# Altium schematic sheet Power_Section.SchDoc
size A4; DocumentNumber: 2; SheetNumber: 2; SheetTotal: 7
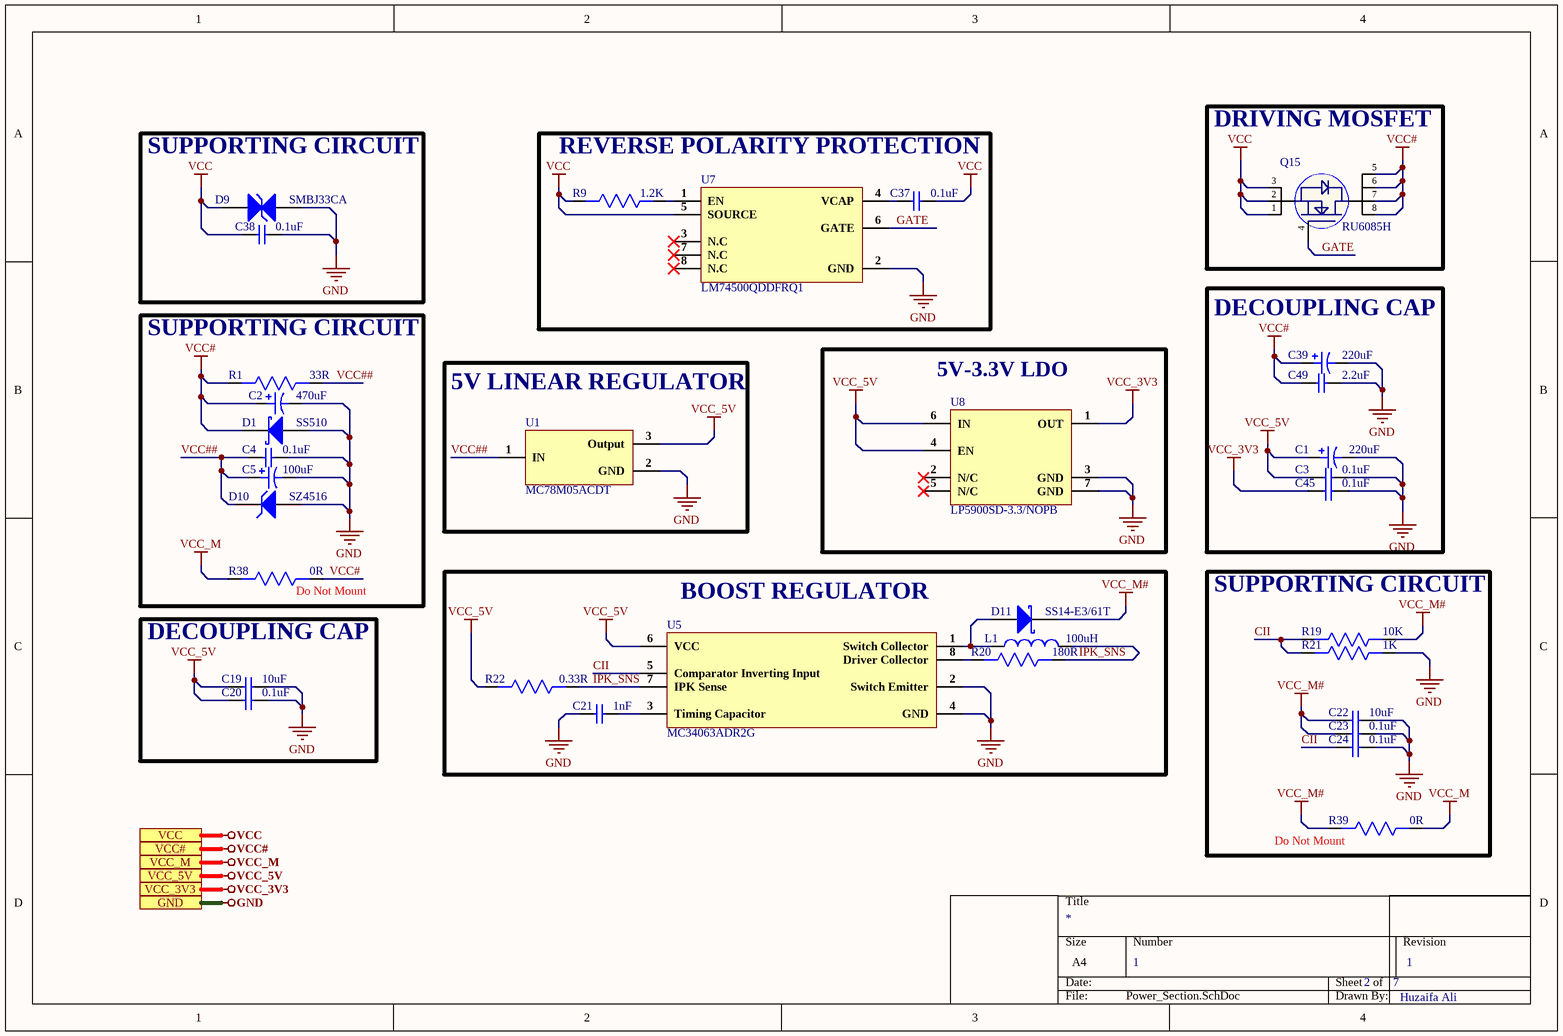
[diagram p0: Power_Section.SchDoc]

## Parts
C1  220uF  [UCD1H221MNL1GS]
C2  470uF  [VT1H471MI135000CE0]
C3  0.1uF  [Cap0603]
C4  0.1uF  [Cap0603]
C5  100uF  [CAP- 2917]
C19  10uF  [Cap0603]
C20  0.1uF  [Cap0603]
C21  1nF  [Cap0603]
C22  10uF  [Cap0603]
C23  0.1uF  [Cap0603]
C24  0.1uF  [Cap0603]
C37  0.1uF  [Cap0603]
C38  0.1uF  [Cap0603]
C39  220uF  [UCD1H221MNL1GS]
C45  0.1uF  [Cap0603]
C49  2.2uF  [Cap-0603]
D1  SS510  [SMB]
D9  SMBJ33CA  [SMBJ33CA]
D10  SZ4516  [SMA]
D11  SS14-E3/61T  [SMA]
L1  100uH  [SRN8040-101M]
Q15  RU6085H  [RU6085H]
R1  33R  [Res0603]
R9  1.2K  [Res-0603]
R19  10K  [Res0603]
R20  180R  [Res0603]
R21  1K  [Res0603]
R22  0.33R  [Res0603]
R38  0R  [Res0603]
R39  0R  [Res0603]
U1  MC78M05ACDT  [DPAK]
U5  MC34063ADR2G  [SOIC-8]
U7  LM74500QDDFRQ1  [TSOT-23-8]
U8  LP5900SD-3.3/NOPB  [WSON-6]

## Blocks framed on the sheet
SUPPORTING CIRCUIT: C38 D9
REVERSE POLARITY PROTECTION: C37 R9 U7
DRIVING MOSFET: Q15
DECOUPLING CAP: C1 C3 C39 C45 C49
SUPPORTING CIRCUIT: C2 C4 C5 D1 D10 R1 R38
5V-3.3V LDO: U8
5V LINEAR REGULATOR: U1
DECOUPLING CAP: C19 C20
BOOST REGULATOR: C21 D11 L1 R20 R22 U5
SUPPORTING CIRCUIT: C22-C24 R19 R21 R39

## Ports
GND, VCC, VCC#, VCC_3V3, VCC_5V, VCC_M

## Nets
GND: C1.2 C2.2 C3.2 C4.2 C5.2 C19.2 C20.2 C21.1 C22.2 C23.2 C24.2 C38.2 C39.2 C45.2 C49.2 D1.2(A) D9.2(A2) D10.2(A) R21.1 U1.2(GND) U5.2(Switch_Emitter) U5.4(GND) U7.2(GND) U8.3(GND) U8.7(GND) ; port GND
VCC: C37.2 C38.1 D9.1(A1) Q15.1(S) Q15.2(S) Q15.3(S) R9.2 U7.5(SOURCE) ; port VCC
VCC#: C2.1 C39.1 C49.1 D1.1(K) Q15.5(D) Q15.6(D) Q15.7(D) Q15.8(D) R1.2 R38.1 ; port VCC#
VCC_3V3: C45.1 U8.1(OUT) ; port VCC_3V3
VCC_5V: C1.1 C3.1 C19.1 C20.1 R22.2 U1.3(Output) U5.6(VCC) U8.4(EN) U8.6(IN) ; port VCC_5V
VCC_M: R38.2 R39.1 ; port VCC_M
VCC_M#: C22.1 C23.1 D11.1(K) R19.1 R39.2
CII: C24.1 R19.2 R21.2 U5.5(Comparator_Inverting_Input)
GATE: Q15.4(G) U7.6(GATE)
IPK_SNS: L1.2 R20.1 R22.1 U5.7(IPK_Sense)
VCC##: C4.1 C5.1 D10.1(K) R1.1 U1.1(IN)
NetC21_2: C21.2 U5.3(Timing_Capacitor)
NetC37_1: C37.1 U7.4(VCAP)
NetD11_2: D11.2(A) L1.1 U5.1(Switch_Collector)
NetR9_1: R9.1 U7.1(EN)
NetR20_2: R20.2 U5.8(Driver_Collector)

Not connected (* = marked no-connect by the designer): U7 3(N.C)* 7(N.C)* 8(N.C)*; U8 2(N/C)* 5(N/C)*

## Notes on the sheet
- (near R38) Do Not Mount
- (near R39) Do Not Mount
- 1
- Huzaifa Ali

## Library data of the parts
C1 C39 = UCD1H221MNL1GS: CAP ALUM 220UF 20% 50V SMD; Manufacturer: Nichicon; Ripple Current: 700mA; Impedance: 160mR; Leakage Current: 3uA; Life (Hours): 5000Hour; Dissipation Factor: 0.1%; Supplier 1: Digi-Key; Manufacturer Part Number: UCD1H221MNL1GS; RoHS: Yes; Category: Aluminum Electrolytic Capacitors; Pricing 1: 1=0.85000, 10=0.60200, 50=0.45480, 100=0.39620 (USD); Mount: Surface Mount,PCB; Case/Package: Radial; Min Operating Temperature: -55°C; Max Operating Temperature: 105°C; Capacitance: 220uF; Tolerance: 20%; Voltage Rating: 50V; Packaging: Tape and Reel; Package Quantity: 1; Voltage Rating (DC): 50V; Termination: SMD/SMT; Voltage: 50V; Features: General Purpose; Series: CD; Construction: Cylindrical; Diameter: 10mm; Length: 10mm; Height: 10mm; Height - Seated (Max): 0.394inch; Radiation Hardening: No; Lead Free: Lead Free; RoHS Compliant: Yes; ComponentLink1URL: https://datasheet.ciiva.com/11776/0900766b80ebdadd-11776792.pdf?src-supplier=RSComponents; ComponentLink1Description: https://datasheet.ciiva.com/11776/0900766b80ebdadd-11776792.pdf?src-supplier=RSComponents; ComponentLink2URL: https://datasheet.ciiva.com/5362/e-cd-22158-5362489.pdf?src-supplier=Mouser; ComponentLink2Description: https://datasheet.ciiva.com/5362/e-cd-22158-5362489.pdf?src-supplier=Mouser; ComponentLink3URL: https://datasheet.ciiva.com/11684/e-cd-11684678.pdf?src-supplier=Avnet; ComponentLink3Description: https://datasheet.ciiva.com/11684/e-cd-11684678.pdf?src-supplier=Avnet; ComponentLink4URL: https://datasheet.ciiva.com/15037/e-cd-15037119.pdf?src-supplier=Digi-Key; ComponentLink4Description: https://datasheet.ciiva.com/15037/e-cd-15037119.pdf?src-supplier=Digi-Key; ComponentLink5URL: https://datasheet.ciiva.com/16393/e-cd-16393493.pdf?src-supplier=Future+Electronics; ComponentLink5Description: https://datasheet.ciiva.com/16393/e-cd-16393493.pdf?src-supplier=Future+Electronics; ComponentLink6URL: https://datasheet.ciiva.com/17354/e-cd-17354606.pdf?src-supplier=Avnet+Europe; ComponentLink6Description: https://datasheet.ciiva.com/17354/e-cd-17354606.pdf?src-supplier=Avnet+Europe; Supplier Part Number 1: 493-6390-1-ND
C2 = VT1H471MI135000CE0: 470uF ±20% 50V 12.5mm 13.5mm 1000hrs 105℃ -40℃~+105℃ SMD,12.5x13.5mm Aluminum Electrolytic Capacitors - SMD RoHS; Manufacturer: Changzhou Huawei Elec; Package: SMD,12.5x13.5mm; Capacitance: 470uF; Tolerance: ±20%; Rated Voltage: 50V; φD: 12.5mm; L: 13.5mm; Lifetime @ Temp: 1000hrs 105℃; Operating Temperature: -40℃~+105℃
C3 C4 C20 C23 C24 C37 C38 C45 = CC0603KRX7R0BB104: CAP CER 0.1UF 100V X7R 0603; Manufacturer: Yageo; Capacitance: 100nF; Tolerance: 10%; Supplier 1: Digi-Key; Manufacturer Part Number: CC0603KRX7R0BB104; RoHS: Yes; Category: Ceramic Capacitors; Stock 1: 60476; Pricing 1: 1=0.19000, 10=0.13500, 50=0.07680, 100=0.06370, 500=0.04466, 1000=0.03696 (USD); Mount: Surface Mount; Case/Package: 0603; Case Code (Metric): 1608; Case Code (Imperial): 0603; Weight: 7.1E-05oz; Min Operating Temperature: -55°C; Max Operating Temperature: 125°C; Package Quantity: 4000; Voltage Rating: 100V; Packaging: Tape and Reel; Dielectric: X7R; Termination: SMD/SMT; Resistor Type: Ceramic; Voltage Rating (DC): 100V; Series: CC; Length: 0.063inch; Width: 0.031inch; Thickness: 0.035inch; Depth: 0.8mm; Lead Free: Lead Free; RoHS Compliant: Yes; ComponentLink1URL: https://datasheet.ciiva.com/6277/mlccorderingcode-6277030.pdf?src-supplier=Digi-Key; ComponentLink1Description: https://datasheet.ciiva.com/6277/mlccorderingcode-6277030.pdf?src-supplier=Digi-Key; ComponentLink2URL: https://datasheet.ciiva.com/6277/mlccorderingcode-6277081.pdf?src-supplier=Digi-Key; ComponentLink2Description: https://datasheet.ciiva.com/6277/mlccorderingcode-6277081.pdf?src-supplier=Digi-Key; ComponentLink3URL: https://datasheet.ciiva.com/6277/mlccorderingcode-6277082.pdf?src-supplier=Digi-Key; ComponentLink3Description: https://datasheet.ciiva.com/6277/mlccorderingcode-6277082.pdf?src-supplier=Digi-Key; Supplier Part Number 1: 311-1523-1-ND
C5 = TAJE107M025RNJ: CAP TANT 100UF 20% 25V 2917; Manufacturer: Kyocera AVX; ESR (Equivalent Series Resistance): 300mR; Leakage Current: 25uA; Polarity: Polar; Dissipation Factor: 10%; Supplier 1: Mouser; Manufacturer Part Number: TAJE107M025RNJ; RoHS: Yes; Category: Tantalum Capacitors; Stock 1: 109; Pricing 1: 1=2.81000, 10=2.81000, 50=2.81000, 100=2.19000, 1000=1.76000, 10000=1.76000 (USD); Mount: Surface Mount; Case/Package: 2917; Number of Pins: 2; Case Code (Imperial): 2917; Case Code (Metric): 7343; Min Operating Temperature: -55°C; Max Operating Temperature: 125°C; Capacitance: 100uF; Tolerance: 20%; Packaging: Tape and Reel; Voltage Rating: 25V; Voltage Rating (DC): 25V; Features: General Purpose; Package Quantity: 1; Termination: SMD/SMT; Series: TAJ; Construction: Flat; Length: 7.3mm; Width: 4.3mm; Height: 4.3mm; Depth: 4.3mm; Height - Seated (Max): 0.169inch; Radiation Hardening: No; Lead Free: Lead Free; RoHS Compliant: Yes; REACH SVHC: No SVHC; ComponentLink1URL: https://datasheet.ciiva.com/26787/taje107m025rnj-26787048.pdf?src-supplier=IIIC; ComponentLink1Description: https://datasheet.ciiva.com/26787/taje107m025rnj-26787048.pdf?src-supplier=IIIC; ComponentLink2URL: https://datasheet.ciiva.com/265/taj-265541.pdf?src-supplier=Digi-Key; ComponentLink2Description: https://datasheet.ciiva.com/265/taj-265541.pdf?src-supplier=Digi-Key; ComponentLink3URL: https://datasheet.ciiva.com/265/taj-265542.pdf?src-supplier=Digi-Key; ComponentLink3Description: https://datasheet.ciiva.com/265/taj-265542.pdf?src-supplier=Digi-Key; ComponentLink4URL: https://datasheet.ciiva.com/265/taj-265540.pdf?src-supplier=Digi-Key; ComponentLink4Description: https://datasheet.ciiva.com/265/taj-265540.pdf?src-supplier=Digi-Key; ComponentLink5URL: https://datasheet.ciiva.com/28609/1719052-28609254.pdf?src-supplier=Element14; ComponentLink5Description: https://datasheet.ciiva.com/28609/1719052-28609254.pdf?src-supplier=Element14; ComponentLink6URL: https://datasheet.ciiva.com/11230/taj-11230456.pdf?src-supplier=Avnet; ComponentLink6Description: https://datasheet.ciiva.com/11230/taj-11230456.pdf?src-supplier=Avnet; ComponentLink7URL: https://datasheet.ciiva.com/17339/taj-17339677.pdf?src-supplier=Avnet+Europe; ComponentLink7Description: https://datasheet.ciiva.com/17339/taj-17339677.pdf?src-supplier=Avnet+Europe; ComponentLink8URL: https://datasheet.ciiva.com/22667/1719052-22667581.pdf?src-supplier=Element14; ComponentLink8Description: https://datasheet.ciiva.com/22667/1719052-22667581.pdf?src-supplier=Element14; Supplier Part Number 1: 581-TAJE107M025RNJ
C19 C22 = CL10A106MA8NRNC: CAP CER 10UF 25V X5R 0603; Manufacturer: Samsung; Tolerance: 20%; Supplier 1: Avnet; Manufacturer Part Number: CL10A106MA8NRNC; RoHS: Yes; Category: Ceramic Capacitors; Pricing 1: 4000=0.03753, 8000=0.03700, 16000=0.03595, 24000=0.03515, 32000=0.03383, 40000=0.03304, 400000=0.03225 (USD); Mount: Surface Mount; Case/Package: 0603; Case Code (Metric): 1608; Case Code (Imperial): 0603; Contact Plating: Tin; Min Operating Temperature: -55°C; Max Operating Temperature: 85°C; Package Quantity: 1; Packaging: Tape and Reel; Capacitance: 10uF; Voltage Rating: 25V; Dielectric: X5R; Termination: Wraparound; Series: CL; Construction: Flat; Length: 0.063inch; Width: 0.031inch; Thickness: 0.035inch; Lead Free: Lead Free; RoHS Compliant: Yes; ComponentLink1URL: https://datasheet.ciiva.com/25766/cl10a106ma8nrnc-25766562.pdf?src-supplier=Digi-Key; ComponentLink1Description: https://datasheet.ciiva.com/25766/cl10a106ma8nrnc-25766562.pdf?src-supplier=Digi-Key; Supplier Part Number 1: CL10A106MA8NRNC
C21 = CL10B102KC8NNNC: CAP CER 1nF 100V X7R 0603; Manufacturer: Samsung; Material: Ceramic; Tolerance: 10%; Supplier 1: Avnet; Manufacturer Part Number: CL10B102KC8NNNC; RoHS: Yes; Category: Ceramic Capacitors; Stock 1: 184000; Pricing 1: 4000=0.00988, 8000=0.00987, 16000=0.00986, 24000=0.00985, 32000=0.00984, 40000=0.00982, 400000=0.00981 (USD); Mount: Surface Mount; Case/Package: 0603; Case Code (Metric): 1608; Case Code (Imperial): 0603; Contact Plating: Tin; Min Operating Temperature: -55°C; Max Operating Temperature: 125°C; Capacitance: 1nF; Dielectric: X7R; Packaging: Tape and Reel; Package Quantity: 1; Voltage Rating: 100V; Voltage: 100V; Voltage Rating (DC): 100V; Series: CL; Construction: Flat; Length: 1.6mm; Width: 0.031inch; Height: 0.8mm; Thickness: 0.035inch; Depth: 0.8mm; Radiation Hardening: No; Lead Free: Lead Free; RoHS Compliant: Yes; ComponentLink1URL: https://datasheet.ciiva.com/25799/cl10b102kc8nnnc-25799476.pdf?src-supplier=Digi-Key; ComponentLink1Description: https://datasheet.ciiva.com/25799/cl10b102kc8nnnc-25799476.pdf?src-supplier=Digi-Key; ComponentLink2URL: https://datasheet.ciiva.com/29198/458286-da-01-en-vs-kondensator-0603-29198496.pdf?src-supplier=Conrad; ComponentLink2Description: https://datasheet.ciiva.com/29198/458286-da-01-en-vs-kondensator-0603-29198496.pdf?src-supplier=Conrad; ComponentLink3URL: https://datasheet.ciiva.com/26838/getdatasheetpartid-640779-26838395.pdf?src-supplier=Verical; ComponentLink3Description: https://datasheet.ciiva.com/26838/getdatasheetpartid-640779-26838395.pdf?src-supplier=Verical; ComponentLink4URL: https://datasheet.ciiva.com/26310/mlcc-catalogdownload2013-eng-26310266.pdf?src-supplier=Distrelec; ComponentLink4Description: https://datasheet.ciiva.com/26310/mlcc-catalogdownload2013-eng-26310266.pdf?src-supplier=Distrelec; ComponentLink5URL: https://datasheet.ciiva.com/16199/cl05b104kq5nnnc-16199246.pdf?src-supplier=Future+Electronics; ComponentLink5Description: https://datasheet.ciiva.com/16199/cl05b104kq5nnnc-16199246.pdf?src-supplier=Future+Electronics; Supplier Part Number 1: CL10B102KC8NNNC
C49 = GRM188R6YA225KA12D: CAP, 2.2µF, 35V, 10%, X5R, 0603; Manufacturer: Murata; Material: Ceramic; Supplier 1: Digi-Key; Manufacturer Part Number: GRM188R6YA225KA12D; RoHS: Yes; Category: Ceramic Capacitors; Stock 1: 81665; Pricing 1: 1=0.21000, 10=0.14100, 50=0.08480, 100=0.07170, 500=0.04904, 1000=0.04338 (USD); Mount: Surface Mount; Case/Package: 0603; Case Code (Metric): 1608; Case Code (Imperial): 0603; Weight: 0.000222oz; Min Operating Temperature: -55°C; Max Operating Temperature: 85°C; Package Quantity: 4000; Packaging: Tape and Reel; Capacitance: 2.2uF; Tolerance: 10%; Voltage Rating: 35V; Dielectric: X5R; Voltage: 35V; Termination: SMD/SMT; Voltage Rating (DC): 35V; Series: GRM; Length: 1.6mm; Width: 0.8mm; Height: 0.8mm; Thickness: 0.035inch; Depth: 0.8mm; REACH SVHC: No SVHC; Lead Free: Lead Free; RoHS Compliant: Yes; ComponentLink1URL: https://datasheet.ciiva.com/14906/partnumbering-e-01-14906490.pdf?src-supplier=Digi-Key; ComponentLink1Description: https://datasheet.ciiva.com/14906/partnumbering-e-01-14906490.pdf?src-supplier=Digi-Key; ComponentLink2URL: https://datasheet.ciiva.com/14906/partnumbering-e-01-14906491.pdf?src-supplier=Digi-Key; ComponentLink2Description: https://datasheet.ciiva.com/14906/partnumbering-e-01-14906491.pdf?src-supplier=Digi-Key; ComponentLink3URL: https://datasheet.ciiva.com/14906/partnumbering-e-01-14906492.pdf?src-supplier=Digi-Key; ComponentLink3Description: https://datasheet.ciiva.com/14906/partnumbering-e-01-14906492.pdf?src-supplier=Digi-Key; Supplier Part Number 1: 490-7204-1-ND; LCSC Part Number: C86017
D1 = SS510: 300μA@100V 100V Single 5A 850mV@5A SMB Schottky Barrier Diodes (SBD) ROHS; Manufacturer: YFW; Manufacturer Part Number: SS510; ComponentLink1Description: LCSC; ComponentLink1URL: https://lcsc.com/product-detail/Schottky-Barrier-Diodes-SBD_YFW-SS510_C2898359.html
D9 = SMBJ33CA: 11.3A 53.3V 36.7V 33V Bi-Directional SMB(DO-214AA) TVS ROHS; Manufacturer: Brightking Elec (TAIWAN); Package: DO-124AA; Maximum Clamping Voltage: 53.3V; Breakdown Voltage (Min): 36.7V; Reverse Stand-Off Voltage (Vrwm): 33V; Polarity: Bi-directional
D10 = SZ4516: 500nA@12.2V ±5% 8Ω Single 2W 16V SMA Zener Diodes ROHS; Manufacturer: LGE; Manufacturer Part Number: SZ4516; ComponentLink1Description: LCSC; ComponentLink1URL: https://lcsc.com/product-detail/span-style-background-color-ff0-Zener-span-Diodes_LGE-SZ4516_C2903793.html
D11 = SS14-E3/61T: 40V 500mV@1A 1A SMA(DO-214AC) Schottky Barrier Diodes (SBD) ROHS; Manufacturer: Vishay Semiconductors; Forward Voltage: 500mV; Max Reverse Current: 200uA; Element Configuration: Single; Peak Non-Repetitive Surge Current: 40A; Polarity: Standard; Supplier 1: Arrow Electronics; Manufacturer Part Number: SS14-E3/61T; RoHS: Yes; Category: Rectifier Diodes; Stock 1: 100; Pricing 1: 1=0.14040, 10=0.13900, 25=0.11710, 100=0.10990 (USD); Mount: Surface Mount; Case/Package: SMA; Number of Pins: 2; Contact Plating: Tin,Matte; Min Operating Temperature: -65°C; Max Operating Temperature: 125°C; Packaging: Tape and Reel; Forward Current: 1A; Max Repetitive Reverse Voltage (Vrrm): 40V; Max Forward Surge Current (Ifsm): 40A; Voltage Rating (DC): 40V; Current Rating: 1A; Output Current: 1A; Max Surge Current: 40A; Package Quantity: 1; Max Reverse Leakage Current: 200uA; Average Rectified Current: 1A; Current: 1A; Voltage: 40V; Max Reverse Voltage (DC): 40V; Series: -; Termination: SMD/SMT; Length: 4.6mm; Width: 2.9mm; Radiation Hardening: No; Lead Free: Lead Free; REACH SVHC: Unknown; Supplier Part Number 1: SS14-E3/61T
L1 = SRN8040-101M: FIXED IND 100UH 1A 400 MOHM SMD; Manufacturer: Bourns; Core Material: Ferrite; Material: Steel; Inductance Tolerance: 20%; Shielding: Shielded; DC Resistance (DCR): 400mR; Self Resonant Frequency: 6MHz; Test Frequency: 100kHz; Supplier 1: Arrow Electronics; Manufacturer Part Number: SRN8040-101M; RoHS: Yes; Category: Fixed Inductors; Stock 1: 70; Pricing 1: 1=0.74330, 10=0.57270, 25=0.52540 (USD); Mount: Surface Mount; Case/Package: Nonstandard; Number of Pins: 2; Weight: 0.028607oz; Min Operating Temperature: -40°C; Max Operating Temperature: 125°C; Package Quantity: 1000; Packaging: Tape and Reel; Tolerance: 20%; Inductance: 100uH; Current Rating: 1A; Saturation Current: 1A; Max DC Current: 1A; Termination: SMD/SMT; Resistor Type: Wirewound; RMS Current (Irms): 1A; DC Current: 1A; Series: SRN8040; Sample Rate (Hz): 100kHz; Length: 8mm; Width: 8mm; Height: 4mm; Height - Seated (Max): 0.157inch; Depth: 8.3mm; REACH SVHC: No SVHC; Military Standard: Not; RoHS Compliant: Yes; ComponentLink1URL: https://datasheet.ciiva.com/11802/0900766b80fe1f3f-11802577.pdf?src-supplier=RSComponents; ComponentLink1Description: https://datasheet.ciiva.com/11802/0900766b80fe1f3f-11802577.pdf?src-supplier=RSComponents; ComponentLink2URL: https://datasheet.ciiva.com/1049/srn8040-1049477.pdf?src-supplier=Digi-Key; ComponentLink2Description: https://datasheet.ciiva.com/1049/srn8040-1049477.pdf?src-supplier=Digi-Key; ComponentLink3URL: https://datasheet.ciiva.com/1049/srn8040-1049478.pdf?src-supplier=Digi-Key; ComponentLink3Description: https://datasheet.ciiva.com/1049/srn8040-1049478.pdf?src-supplier=Digi-Key; ComponentLink4URL: https://datasheet.ciiva.com/7849/1695391-7849526.pdf?src-supplier=Element14; ComponentLink4Description: https://datasheet.ciiva.com/7849/1695391-7849526.pdf?src-supplier=Element14; ComponentLink5URL: https://datasheet.ciiva.com/28561/1733536-28561112.pdf?src-supplier=Element14; ComponentLink5Description: https://datasheet.ciiva.com/28561/1733536-28561112.pdf?src-supplier=Element14; ComponentLink6URL: https://datasheet.ciiva.com/6689/srn8040-6689481.pdf?src-supplier=Digi-Key; ComponentLink6Description: https://datasheet.ciiva.com/6689/srn8040-6689481.pdf?src-supplier=Digi-Key; ComponentLink7URL: https://datasheet.ciiva.com/8515/srn8040-8515246.pdf?src-supplier=Avnet; ComponentLink7Description: https://datasheet.ciiva.com/8515/srn8040-8515246.pdf?src-supplier=Avnet; Supplier Part Number 1: SRN8040-101M
Q15 = RU6085H: 60V 80A 2.5W 7mΩ@10V,20A 3V@250μA N Channel SOP-8_150mil MOSFETs ROHS; Manufacturer: Shenzhen; Manufacturer Part No: RU6085H; Package: SOP-8_150mil; ComponentLink1Description: LCSC; ComponentLink1URL: https://lcsc.com/product-detail/MOSFETs_Shenzhen-ruichips-Semicon-RU6085H_C181990.html
R1 = RC0603FR-0733RL: RES SMD 33 OHM 1% 1/10W 0603; Manufacturer: Yageo; Temperature Coefficient: 100ppm/°C; Voltage Rating (DC): 50V; Power Rating: 100mW; Voltage Rating: 75V; Supplier 1: Digi-Key; Manufacturer Part Number: RC0603FR-0733RL; Stock 1: 5529439; Pricing 1: 1=0.1, 10=0.023, 100=0.0094, 1000=0.00421, 2500=0.00366 (USD); Case/Package: 0603; Number of Pins: 2; Weight: 7.1E-05oz; Case Code (Metric): 1608; Case Code (Imperial): 0603; Min Operating Temperature: -55°C; Max Operating Temperature: 155°C; Resistance: 33R; Tolerance: 1%; Composition: Thick Film; Packaging: Tape and Reel; Package Quantity: 1; Number of Terminations: 2; Termination: SMD/SMT; Military Standard: Not; Max Power Dissipation: 100mW; Features: Moisture Resistant; Length: 1.6mm; Height: 0.45mm; Width: 0.8mm; Depth: 0.8mm; Lead Pitch: 0.3mm; REACH SVHC: No SVHC; Lead Free: Lead Free; ComponentLink1URL: http://www.yageo.com/documents/recent/PYu-RC_Group_51_RoHS_L_10.pdf?src-supplier=Digi-Key; ComponentLink1Description: http://www.yageo.com/documents/recent/PYu-RC_Group_51_RoHS_L_10.pdf?src-supplier=Digi-Key; ComponentLink2URL: http://documents.rs-components.com/techlib://itc_doclist_GB.htm?stockno=5046562&src-supplier=RSComponents; ComponentLink2Description: http://documents.rs-components.com/techlib://itc_doclist_GB.htm?stockno=5046562&src-supplier=RSComponents; ComponentLink3URL: http://www.farnell.com/datasheets/38590.pdf?src-supplier=Element14; ComponentLink3Description: http://www.farnell.com/datasheets/38590.pdf?src-supplier=Element14; ComponentLink4URL: https://www.verical.com/server-webapp/html/getDatasheet?partID=326673&src-supplier=Verical; ComponentLink4Description: https://www.verical.com/server-webapp/html/getDatasheet?partID=326673&src-supplier=Verical; ComponentLink5URL: http://www.farnell.com/datasheets/1868787.pdf?src-supplier=Element14; ComponentLink5Description: http://www.farnell.com/datasheets/1868787.pdf?src-supplier=Element14; ComponentLink6URL: http://www.farnell.com/datasheets/2167052.pdf?src-supplier=Element14; ComponentLink6Description: http://www.farnell.com/datasheets/2167052.pdf?src-supplier=Element14; ComponentLink7URL: http://www.farnell.com/datasheets/443971.pdf?src-supplier=Element14; ComponentLink7Description: http://www.farnell.com/datasheets/443971.pdf?src-supplier=Element14; Supplier Part Number 1: 311-33.0HRCT-ND
R9 = RC0603FR-071K2L: RES SMD 1.2K OHM 1% 1/10W 0603; Manufacturer: Yageo; Power Rating: 100mW; Voltage Rating (DC): 50V; Resistance: 1.2kR; Temperature Coefficient: 100ppm/°C; Supplier 1: Digi-Key; Manufacturer Part Number: RC0603FR-071K2L; RoHS: Yes; Category: Chip SMD Resistors; Stock 1: 531140; Pricing 1: 1=0.10000, 10=0.02400, 100=0.00970, 1000=0.00436, 2500=0.00378 (USD); Case/Package: 0603; Number of Pins: 2; Case Code (Imperial): 0603; Case Code (Metric): 1608; Size Code: 0603; Min Operating Temperature: -55°C; Max Operating Temperature: 155°C; Tolerance: 1%; Packaging: Tape and Reel; Voltage Rating: 50V; Termination: SMD/SMT; Resistor Type: Thick Film; Features: Moisture Resistant; Series: RC; Max Power Dissipation: 100mW; Number of Terminations: 2; Construction: Rectangular; Resistance Tolerance: 1%; Length: 1.6mm; Width: 0.8mm; Height: 0.45mm; Depth: 0.8mm; REACH SVHC: No SVHC; Lead Free: Lead Free; Military Standard: Not; RoHS Compliant: Yes; Supplier Part Number 1: 311-1.20KHRCT-ND; LCSC Part Number: C114605
R19 = AC0603JR-0710KL: RES SMD 10K OHM 5% 1/10W 0603; Manufacturer: Yageo; Voltage Rating: 50V; Resistance: 10kR; Power Rating: 100mW; Temperature Coefficient: 100ppm/°C; Supplier 1: Future Electronics; Manufacturer Part Number: AC0603JR-0710KL; RoHS: Yes; Category: Chip SMD Resistors; Stock 1: 1533000; Pricing 1: 5000=0.00540 (USD); Case/Package: 0603; Case Code (Imperial): 0603; Case Code (Metric): 1608; Size Code: 0603; Min Operating Temperature: -55°C; Max Operating Temperature: 155°C; Packaging: Tape and Reel; Tolerance: 5%; Package Quantity: 1; Resistor Type: Thick Film; Termination: SMD/SMT; Number of Terminations: 2; Max Power Dissipation: 100mW; Features: Moisture Resistant,Automotive AEC-Q200,Anti-Sulfur; Series: AC; Construction: Rectangular; Length: 0.063inch; Width: 0.031inch; Height: 0.022inch; Depth: 0.8mm; Military Standard: Not; Lead Free: Lead Free; RoHS Compliant: Yes; ComponentLink1URL: https://datasheet.ciiva.com/5562/pyu-ac-51-rohs-l-2-5562553.pdf?src-supplier=Mouser; ComponentLink1Description: https://datasheet.ciiva.com/5562/pyu-ac-51-rohs-l-2-5562553.pdf?src-supplier=Mouser; Supplier Part Number 1: 1029044
R20 = RT0603CRE07180RL: 100mW Thin Film Resistor 75V ±0.25% ±50ppm/℃ 180Ω -55℃~+155℃ 0603 Chip Resistor - Surface Mount ROHS; Manufacturer: YAGEO; ComponentLink1Description: LCSC; ComponentLink1URL: https://lcsc.com/product-detail/Chip-span-style-background-color-ff0-Resistor-span-Surface-Mount_YAGEO-RT0603CRE07180RL_C705909.html; Manufacturer Part Number: RT0603CRE07180RL; Footprint: 0603
R21 = RC0603JR-071KL: RES SMD 1K OHM 5% 1/10W 0603; Manufacturer: Yageo; Resistance: 1kR; Temperature Coefficient: 100ppm/°C; Voltage Rating (DC): 50V; Power Rating: 100mW; Supplier 1: Digi-Key; Manufacturer Part Number: RC0603JR-071KL; Stock 1: 12490655; Pricing 1: 1=0.1, 10=0.018, 100=0.0072, 1000=0.00323, 2500=0.00281 (USD); Case/Package: 0603; Number of Pins: 2; Contact Plating: Tin,Matte; Case Code (Imperial): 0603; Case Code (Metric): 1608; Min Operating Temperature: -55°C; Max Operating Temperature: 155°C; Tolerance: 5%; Composition: Thick Film; Packaging: Tape and Reel; Package Quantity: 5000; Voltage Rating: 50V; Termination: SMD/SMT; Military Standard: Not; Length: 1.6mm; Height: 0.45mm; Width: 0.8mm; Depth: 0.8mm; Radiation Hardening: No; REACH SVHC: Unknown; Lead Free: Lead Free; ComponentLink1URL: http://www.yageo.com/documents/recent/PYu-RC_Group_51_RoHS_L_2.pdf?src-supplier=Avnet; ComponentLink1Description: http://www.yageo.com/documents/recent/PYu-RC_Group_51_RoHS_L_2.pdf?src-supplier=Avnet; ComponentLink2URL: http://www.farnell.com/datasheets/2167052.pdf?src-supplier=Element14; ComponentLink2Description: http://www.farnell.com/datasheets/2167052.pdf?src-supplier=Element14; ComponentLink3URL: http://www.farnell.com/datasheets/443971.pdf?src-supplier=Element14; ComponentLink3Description: http://www.farnell.com/datasheets/443971.pdf?src-supplier=Element14; ComponentLink4URL: http://www.farnell.com/datasheets/1868787.pdf?src-supplier=Element14; ComponentLink4Description: http://www.farnell.com/datasheets/1868787.pdf?src-supplier=Element14; Supplier Part Number 1: 311-1.0KGRCT-ND
R22 = RTT03R330FTP: ±1% 1/10W Thick Film Resistors 75V ±600ppm/℃ -55℃~+155℃ 0.33Ω 0603 Chip Resistor - Surface Mount ROHS; Manufacturer: RALEC; Manufacturer Part No: RTT03R330FTP; Value: 0.33Ω; Package: 0603
R38 R39 = RC0603FR-070RL: RES SMD 0R, 1%, 0.1W, 0603; Manufacturer: Yageo; Resistance: 0mR; Power Rating: 100mW; Voltage Rating (DC): 50V; Temperature Coefficient: 200ppm/°C; Current Rating: 1A; Working Voltage: 75V; Supplier 1: Arrow Electronics; Manufacturer Part Number: RC0603FR-070RL; RoHS: Yes; Category: Chip SMD Resistors; Stock 1: 1270000; Pricing 1: 5000=0.00320, 5000=0.00490, 50000=0.00450, 500000=0.00250, 2500000=0.00150 (USD); Case/Package: 0603; Number of Pins: 2; Contact Plating: Tin,Matte; Case Code (Metric): 1608; Case Code (Imperial): 0603; Min Operating Temperature: -55°C; Max Operating Temperature: 155°C; Resistor Type: Thick Film; Packaging: Tape and Reel; Tolerance: 1%; Package Quantity: 5000; Voltage Rating: 50V; Number of Terminations: 2; Termination: SMD/SMT; Max Power Dissipation: 100mW; Features: Moisture Resistant; Length: 1.6mm; Width: 0.031inch; Height: 0.45mm; Depth: 0.8mm; Radiation Hardening: No; REACH SVHC: No SVHC; Lead Free: Lead Free; Military Standard: Not; ComponentLink1URL: https://datasheet.ciiva.com/11808/0900766b80f96399-11808172.pdf?src-supplier=RSComponents; ComponentLink1Description: https://datasheet.ciiva.com/11808/0900766b80f96399-11808172.pdf?src-supplier=RSComponents; ComponentLink2URL: https://datasheet.ciiva.com/5558/rc0603-272842-5558341.pdf?src-supplier=Mouser; ComponentLink2Description: https://datasheet.ciiva.com/5558/rc0603-272842-5558341.pdf?src-supplier=Mouser; ComponentLink3URL: https://datasheet.ciiva.com/46382/443971-46382072.pdf?src-supplier=Element14; ComponentLink3Description: https://datasheet.ciiva.com/46382/443971-46382072.pdf?src-supplier=Element14; ComponentLink4URL: https://datasheet.ciiva.com/29721/pyu-r-int-thick-7-29721178.pdf?src-supplier=Digi-Key; ComponentLink4Description: https://datasheet.ciiva.com/29721/pyu-r-int-thick-7-29721178.pdf?src-supplier=Digi-Key; ComponentLink5URL: https://datasheet.ciiva.com/5684/443971-5684699.pdf?src-supplier=Farnell; ComponentLink5Description: https://datasheet.ciiva.com/5684/443971-5684699.pdf?src-supplier=Farnell; ComponentLink6URL: https://datasheet.ciiva.com/7983/443971-7983627.pdf?src-supplier=Element14; ComponentLink6Description: https://datasheet.ciiva.com/7983/443971-7983627.pdf?src-supplier=Element14; ComponentLink7URL: https://datasheet.ciiva.com/29721/pyu-rc0603-51-rohs-l-4-29721179.pdf?src-supplier=Digi-Key; ComponentLink7Description: https://datasheet.ciiva.com/29721/pyu-rc0603-51-rohs-l-4-29721179.pdf?src-supplier=Digi-Key; ComponentLink8URL: https://datasheet.ciiva.com/22643/1868787-22643388.pdf?src-supplier=Element14; ComponentLink8Description: https://datasheet.ciiva.com/22643/1868787-22643388.pdf?src-supplier=Element14; Supplier Part Number 1: RC0603FR-070RL
U1 = MC78M05ACDT: IC REG LINEAR 5V 500MA DPAK; Manufacturer: ON Semiconductor; Manufacturer Part Number: MC78M05ACDTRKG; Number of Outputs: 1; Power Rating: 5W; Dropout Voltage: 2V; Max Input Voltage: 35V; Min Input Voltage: 7V; Polarity: Positive; Quiescent Current: 6mA; Max Output Voltage: 5.1V; Output Voltage Accuracy: 2%; Power Supply Rejection Ratio (PSRR): 80dB; Output Type: Fixed; Supplier 1: Arrow Electronics; RoHS: Yes; Category: Voltage Regulators - Linear; Stock 1: 4440; Pricing 1: 1=0.50430, 10=0.50340, 25=0.49850, 100=0.34200, 250=0.33860, 500=0.33520, 1000=0.23420, 3000=0.19890 (USD); Mount: Surface Mount; Case/Package: DPAK; Number of Pins: 3; Min Operating Temperature: 0°C; Max Operating Temperature: 125°C; Nominal Output Voltage: 5V; Packaging: Tape and Reel; Max Output Current: 500mA; Output Voltage: 5V; Output Current: 500mA; Package Quantity: 1; Number of Regulators: 1; Min Output Voltage: 5V; Accuracy: 2%; Series: -; Length: 6.73mm; Width: 6.22mm; Height: 2.38mm; Radiation Hardening: No; REACH SVHC: No SVHC; Lead Free: Lead Free; Halogen Free: Halogen Free; RoHS Compliant: Yes; ComponentLink1URL: https://datasheet.ciiva.com/8233/mc78m00-d-8233193.pdf?src-supplier=Avnet; ComponentLink1Description: https://datasheet.ciiva.com/8233/mc78m00-d-8233193.pdf?src-supplier=Avnet; ComponentLink2URL: https://datasheet.ciiva.com/2042/mc78m00-d-2042507.pdf?src-supplier=Digi-Key; ComponentLink2Description: https://datasheet.ciiva.com/2042/mc78m00-d-2042507.pdf?src-supplier=Digi-Key; ComponentLink3URL: https://datasheet.ciiva.com/8234/mc78m00-d-8234043.pdf?src-supplier=Avnet; ComponentLink3Description: https://datasheet.ciiva.com/8234/mc78m00-d-8234043.pdf?src-supplier=Avnet; ComponentLink4URL: https://datasheet.ciiva.com/2042/mc78m00-d-2042508.pdf?src-supplier=Digi-Key; ComponentLink4Description: https://datasheet.ciiva.com/2042/mc78m00-d-2042508.pdf?src-supplier=Digi-Key; ComponentLink5URL: https://datasheet.ciiva.com/2042/mc78m00-d-2042509.pdf?src-supplier=Digi-Key; ComponentLink5Description: https://datasheet.ciiva.com/2042/mc78m00-d-2042509.pdf?src-supplier=Digi-Key; ComponentLink6URL: https://datasheet.ciiva.com/4882/mc78m00-d-88441-4882285.pdf?src-supplier=Mouser; ComponentLink6Description: https://datasheet.ciiva.com/4882/mc78m00-d-88441-4882285.pdf?src-supplier=Mouser; ComponentLink7URL: https://datasheet.ciiva.com/16455/mc78m00-d-16455407.pdf?src-supplier=Future+Electronics; ComponentLink7Description: https://datasheet.ciiva.com/16455/mc78m00-d-16455407.pdf?src-supplier=Future+Electronics; Supplier Part Number 1: MC78M05ACDTRKG
U5 = MC34063ADR2G: IC REG BUCK BOOST INV ADJ 8SOIC; Manufacturer: ON Semiconductor; Number of Outputs: 1; Output Voltage: 40V; Max Output Current: 1.5A; Min Input Voltage: 3V; Switching Frequency: 100kHz; Synchronous Rectifier: No; Min Output Voltage: 1.25V; Output Type: Adjustable; Supplier 1: Arrow Electronics; Manufacturer Part Number: MC34063ADR2G; RoHS: Yes; Category: Voltage Regulators - Switching; Stock 1: 2000; Pricing 1: 1=0.59300, 10=0.47930, 25=0.47460, 100=0.29030, 250=0.28740, 500=0.28460, 1000=0.25300, 3000=0.22150 (USD); Mount: Surface Mount; Case/Package: SOIC; Number of Pins: 8; Contact Plating: Tin,Matte; Min Operating Temperature: 0°C; Max Operating Temperature: 70°C; Package Quantity: 1; Packaging: Tape and Reel; Output Current: 1.5A; Max Input Voltage: 40V; Max Output Voltage: 40V; Series: -; Switching Frequency-Max: 100kHz; Length: 5mm; Width: 4mm; Height: 1.5mm; Radiation Hardening: No; REACH SVHC: No SVHC; Lead Free: Lead Free; Halogen Free: Halogen Free; RoHS Compliant: Yes; ComponentLink1URL: https://datasheet.ciiva.com/34301/871666-34301629.pdf?src-supplier=Jameco; ComponentLink1Description: https://datasheet.ciiva.com/34301/871666-34301629.pdf?src-supplier=Jameco; ComponentLink2URL: https://datasheet.ciiva.com/15112/getdatasheetpartid-59933-15112667.pdf?src-supplier=Verical; ComponentLink2Description: https://datasheet.ciiva.com/15112/getdatasheetpartid-59933-15112667.pdf?src-supplier=Verical; ComponentLink3URL: https://datasheet.ciiva.com/2025/mc34063a-d-2025168.pdf?src-supplier=Digi-Key; ComponentLink3Description: https://datasheet.ciiva.com/2025/mc34063a-d-2025168.pdf?src-supplier=Digi-Key; ComponentLink4URL: https://datasheet.ciiva.com/3217/mc34063a-d-3217624.pdf?src-supplier=Avnet; ComponentLink4Description: https://datasheet.ciiva.com/3217/mc34063a-d-3217624.pdf?src-supplier=Avnet; ComponentLink5URL: https://datasheet.ciiva.com/3217/mc34063a-d-3217493.pdf?src-supplier=Avnet; ComponentLink5Description: https://datasheet.ciiva.com/3217/mc34063a-d-3217493.pdf?src-supplier=Avnet; ComponentLink6URL: https://datasheet.ciiva.com/2025/mc34063a-d-2025169.pdf?src-supplier=Digi-Key; ComponentLink6Description: https://datasheet.ciiva.com/2025/mc34063a-d-2025169.pdf?src-supplier=Digi-Key; ComponentLink7URL: https://datasheet.ciiva.com/2025/mc34063a-d-2025167.pdf?src-supplier=Digi-Key; ComponentLink7Description: https://datasheet.ciiva.com/2025/mc34063a-d-2025167.pdf?src-supplier=Digi-Key; Supplier Part Number 1: MC34063ADR2G
U7 = LM74500QDDFRQ1: REVERSE POLARITY PROTECTION CONT; Manufacturer: Texas Instruments; Supplier 1: Mouser; Manufacturer Part Number: LM74500QDDFRQ1; RoHS: No; Category: Battery Management; Pricing 1: 1=1.77000, 10=1.60000, 50=1.51000, 100=1.29000, 1000=0.87600, 10000=0.87500 (USD); Supplier Part Number 1: 595-LM74500QDDFRQ1
U8 = LP5900SD-3.3/NOPB: IC REG LINEAR 3.3V 150MA 6WSON; Manufacturer: TI National Semiconductor; Dropout Voltage: 80mV; Number of Outputs: 1; Min Input Voltage: 2.5V; Max Input Voltage: 5.5V; Polarity: Positive; Quiescent Current: 50uA; Output Voltage Accuracy: 2%; Output Type: Fixed; Max Supply Current: 230uA; Power Supply Rejection Ratio (PSRR): 40dB; Supplier 1: Digi-Key; Manufacturer Part Number: LP5900SD-3.3/NOPB; RoHS: Yes; Category: Voltage Regulators - Linear; Stock 1: 36260; Pricing 1: 1=1.01000, 10=0.90700, 25=0.86080, 100=0.70700, 250=0.66092, 500=0.58406 (USD); Mount: Surface Mount; Number of Pins: 6; Min Operating Temperature: -40°C; Max Operating Temperature: 85°C; Output Voltage: 3.3V; Output Current: 150mA; Package Quantity: 1000; Packaging: Tape and Reel; Max Output Current: 150mA; Nominal Output Voltage: 3.3V; Accuracy: 2%; Series: -; Number of Regulators: 1; Max Supply Voltage: 5.5V; Min Supply Voltage: 2.5V; Termination: SMD/SMT; Output Configuration: Positive; Length: 2.2mm; Width: 2.5mm; Height: 0.8mm; Radiation Hardening: No; REACH SVHC: No SVHC; Lead Free: Lead Free; ComponentLink1URL: https://datasheet.ciiva.com/3223/lp5900-3223991.pdf?src-supplier=Avnet; ComponentLink1Description: https://datasheet.ciiva.com/3223/lp5900-3223991.pdf?src-supplier=Avnet; ComponentLink2URL: https://datasheet.ciiva.com/6598/lp5900-6598143.pdf?src-supplier=Digi-Key; ComponentLink2Description: https://datasheet.ciiva.com/6598/lp5900-6598143.pdf?src-supplier=Digi-Key; ComponentLink3URL: https://datasheet.ciiva.com/6598/lp5900-6598142.pdf?src-supplier=Digi-Key; ComponentLink3Description: https://datasheet.ciiva.com/6598/lp5900-6598142.pdf?src-supplier=Digi-Key; Supplier Part Number 1: LP5900SD-3.3/NOPBCT-ND